# Altium schematic sheet ffultra_human-interfaces.SchDoc
size A4; SheetNumber: 13; SheetTotal: 13
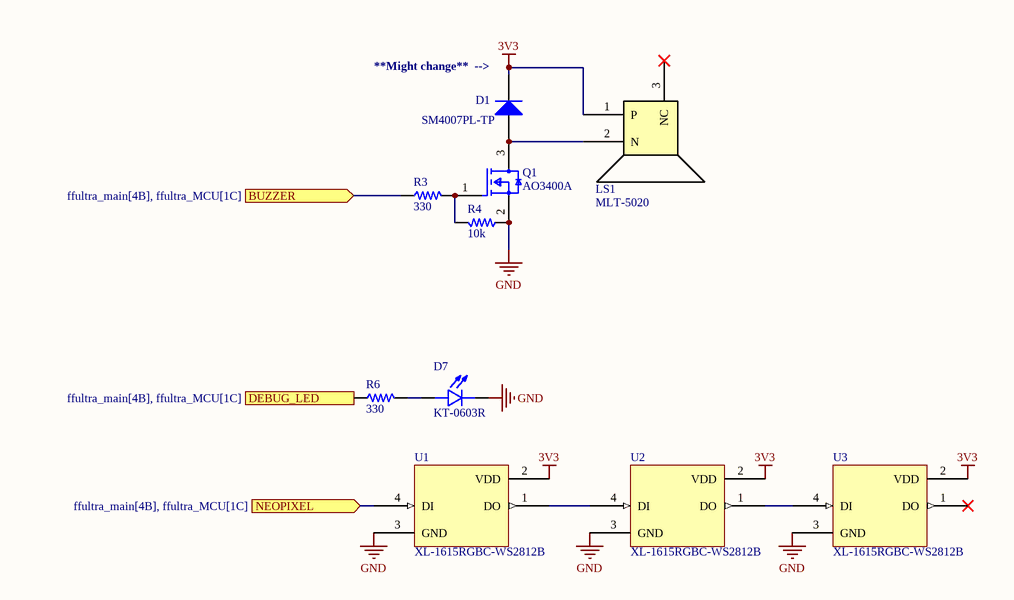
[diagram p0: ffultra_human-interfaces.SchDoc]

## Parts
D1  SM4007PL-TP  [MCC-SOD-123FL_V]
D7  KT-0603R  [LED_KT-0603R]
LS1  MLT-5020  [MLT-5020]
Q1  AO3400A  [FP-SOT23-IPC_C]
R3  value 330  [RES-0402]  (hidden comment: 0402WGF3300TCE)
R4  value 10k  [RES-0402]  (hidden comment: 0402WGF1002TCE)
R6  value 330  [RES-0402]  (hidden comment: 0402WGF3300TCE)
U1  XL-1615RGBC-WS2812B  [XL-1615RGBC-WS2812B-Footprint-1]
U2  XL-1615RGBC-WS2812B  [XL-1615RGBC-WS2812B-Footprint-1]
U3  XL-1615RGBC-WS2812B  [XL-1615RGBC-WS2812B-Footprint-1]

## Ports
BUZZER (in, see ffultra_main[4B], ffultra_MCU[1C]), DEBUG_LED (in, see ffultra_main[4B], ffultra_MCU[1C]), NEOPIXEL (in, see ffultra_main[4B], ffultra_MCU[1C])

## Nets
3V3: D1.2(K) LS1.1(P) U1.2(VDD) U2.2(VDD) U3.2(VDD)
GND: D7.C Q1.2(S) R4.1 U1.3(GND) U2.3(GND) U3.3(GND)
BUZZER: R3.1 ; port BUZZER
DEBUG_LED: R6.1 ; port DEBUG_LED
NEOPIXEL: U1.4(DI) ; port NEOPIXEL
NetD1_1: D1.1(A) LS1.2(N) Q1.3(D)
NetD7_A: D7.A R6.2
NetQ1_1: Q1.1(G) R3.2 R4.2
NetU1_1: U1.1(DO) U2.4(DI)
NetU2_1: U2.1(DO) U3.4(DI)

Not connected (* = marked no-connect by the designer): LS1 3(NC)*; U3 1(DO)*

## Notes on the sheet
- (near D1) **Might change**  -->

## Library data of the parts
D1 = CMP-004-00034-1: DIODE GEN PURP 1KV 1A SOD123FL; LCSC Part #: C64898; JLCPCB Part Number: C64898
D7 = CMP-004-00035-2: Red 0603 Light Emitting Diodes; MF: Hubei KENTO Elec; Value: *; Pins: 2; Design Item ID: KT-0603R; MP: KT-0603R; Case/Package: Package; Component Type: Standard; Check_prices: https://www.snapeda.com/parts/KT-0603R/Hubei+KENTO+Elec/view-part/?ref=eda; SnapEDA_Link: https://www.snapeda.com/parts/KT-0603R/Hubei+KENTO+Elec/view-part/?ref=snap; JLCPCB Part Number: C2286; Source: KT-0603R.SchLib
LS1 = CMP-00027-00002-1: Externally Driven Magnetic 4000Hz SMD,5x5mm  Buzzers ROHS; JLCPCB Part Number: C94598
Q1 = CMP-013-00038-1: N沟道 VDS=30V VGS=±12V ID=5.7A P=1.4W; LCSC Part #: C20917; JLCPCB Part Number: C20917
R3 R6 = CMP-009-00220-1: Resistor, 330Ω, ±1%, 62.5mW, 50V, ±100ppm/℃, -55℃~+155℃, SMD 0402; Manufacturer: Uniroyal; ComponentLink1Description: Datasheet; Category: Resistors; Temperature Rating: -55℃~+155℃; Temperature Coefficient: ±100ppm/℃; Tolerance: 1%; ComponentLink1URL: https://datasheet.lcsc.com/lcsc/2205311900_UNI-ROYAL-Uniroyal-Elec-0402WGF3300TCE_C25104.pdf; Design Item ID: 0402WGF3300TCE; JLCPCB Part Number: C25104; ComponentLink2URL: https://jlcpcb.com/partdetail/C25104; Manufacturer Part Number: 0402WGF3300TCE; Case/Package: 0402; JLCPCB Basic Part: Yes; ComponentLink2Description: JLCPCB Part URL; Source: jlcpcb_resistors_basic.schlib; Power Rating: 62.5mW; Voltage Rating: 50V
R4 = CMP-009-00191-1: Resistor, 10kΩ, ±1%, 62.5mW, 50V, ±100ppm/℃, -55℃~+155℃, SMD 0402; Manufacturer: Uniroyal; Temperature Rating: -55℃~+155℃; ComponentLink1URL: https://datasheet.lcsc.com/lcsc/2206010100_UNI-ROYAL-Uniroyal-Elec-0402WGF1002TCE_C25744.pdf; Source: jlcpcb_resistors_basic.schlib; Tolerance: 1%; Design Item ID: 0402WGF1002TCE; ComponentLink1Description: Datasheet; ComponentLink2URL: https://jlcpcb.com/partdetail/C25744; Category: Resistors; JLCPCB Part Number: C25744; ComponentLink2Description: JLCPCB Part URL; Temperature Coefficient: ±100ppm/℃; JLCPCB Basic Part: Yes; Power Rating: 62.5mW; Case/Package: 0402; Voltage Rating: 50V; Manufacturer Part Number: 0402WGF1002TCE
U1-U3 = CMP-007-00038-2: 1615 RGB LEDs(Built-in IC) ROHS; JLCPCB Part Number: C5349954